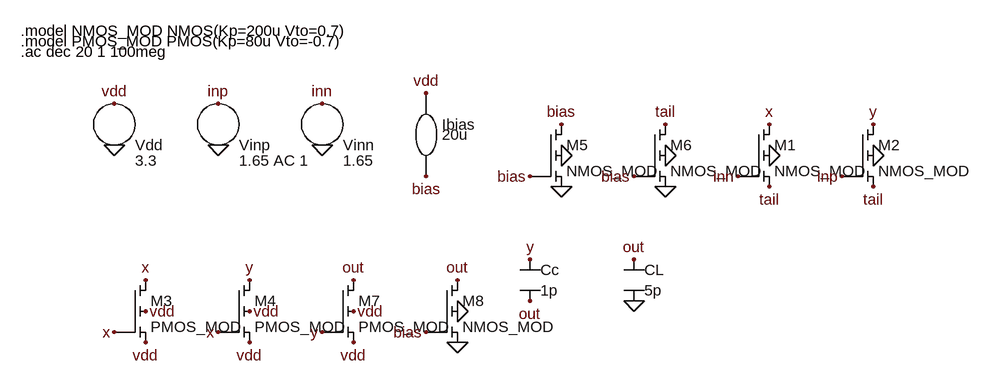
[diagram p0: schematic two_stage_opamp_labelled.asc]
two_stage_opamp_labelled.asc, the LTspice schematic file:
Version 4
SHEET 1 880 680
FLAG 160 128 vdd
FLAG 160 192 0
FLAG 320 128 inp
FLAG 320 192 0
FLAG 480 128 inn
FLAG 480 192 0
FLAG 640 112 vdd
FLAG 640 240 bias
FLAG 848 160 bias
FLAG 800 240 bias
FLAG 848 256 0
FLAG 848 208 0
FLAG 1008 160 tail
FLAG 960 240 bias
FLAG 1008 256 0
FLAG 1008 208 0
FLAG 1168 160 x
FLAG 1120 240 inn
FLAG 1168 256 tail
FLAG 1168 208 0
FLAG 1328 160 y
FLAG 1280 240 inp
FLAG 1328 256 tail
FLAG 1328 208 0
FLAG 208 400 x
FLAG 160 480 x
FLAG 208 496 vdd
FLAG 208 448 vdd
FLAG 368 400 y
FLAG 320 480 x
FLAG 368 496 vdd
FLAG 368 448 vdd
FLAG 528 400 out
FLAG 480 480 y
FLAG 528 496 vdd
FLAG 528 448 vdd
FLAG 688 400 out
FLAG 640 480 bias
FLAG 688 496 0
FLAG 688 448 0
FLAG 800 368 y
FLAG 800 432 out
FLAG 960 368 out
FLAG 960 432 0
SYMBOL voltage 160 160 R0
SYMATTR InstName Vdd
SYMATTR Value 3.3
SYMBOL voltage 320 160 R0
SYMATTR InstName Vinp
SYMATTR Value 1.65 AC 1
SYMBOL voltage 480 160 R0
SYMATTR InstName Vinn
SYMATTR Value 1.65
SYMBOL current 640 160 R0
SYMATTR InstName Ibias
SYMATTR Value 20u
SYMBOL nmos4 800 160 R0
SYMATTR InstName M5
SYMATTR Value NMOS_MOD
SYMBOL nmos4 960 160 R0
SYMATTR InstName M6
SYMATTR Value NMOS_MOD
SYMBOL nmos4 1120 160 R0
SYMATTR InstName M1
SYMATTR Value NMOS_MOD
SYMBOL nmos4 1280 160 R0
SYMATTR InstName M2
SYMATTR Value NMOS_MOD
SYMBOL pmos4 160 400 R0
SYMATTR InstName M3
SYMATTR Value PMOS_MOD
SYMBOL pmos4 320 400 R0
SYMATTR InstName M4
SYMATTR Value PMOS_MOD
SYMBOL pmos4 480 400 R0
SYMATTR InstName M7
SYMATTR Value PMOS_MOD
SYMBOL nmos4 640 400 R0
SYMATTR InstName M8
SYMATTR Value NMOS_MOD
SYMBOL cap 800 400 R0
SYMATTR InstName Cc
SYMATTR Value 1p
SYMBOL cap 960 400 R0
SYMATTR InstName CL
SYMATTR Value 5p
TEXT 16 16 Left 2 !.model NMOS_MOD NMOS(Kp=200u Vto=0.7)
TEXT 16 32 Left 2 !.model PMOS_MOD PMOS(Kp=80u Vto=-0.7)
TEXT 16 48 Left 2 !.ac dec 20 1 100meg

The netlist it stands for:
* two_stage_opamp_labelled.asc
Vdd vdd 0 3.3
Vinp inp 0 1.65 AC 1
Vinn inn 0 1.65
Ibias vdd bias 20u
M5 bias bias 0 0 NMOS_MOD
M6 tail bias 0 0 NMOS_MOD
M1 x inn tail 0 NMOS_MOD
M2 y inp tail 0 NMOS_MOD
M3 x x vdd vdd PMOS_MOD
M4 y x vdd vdd PMOS_MOD
M7 out y vdd vdd PMOS_MOD
M8 out bias 0 0 NMOS_MOD
Cc y out 1p
CL out 0 5p
.model NMOS NMOS
.model PMOS PMOS
.lib standard.mos
.model NMOS_MOD NMOS(Kp=200u Vto=0.7)
.model PMOS_MOD PMOS(Kp=80u Vto=-0.7)
.ac dec 20 1 100meg
.backanno
.end